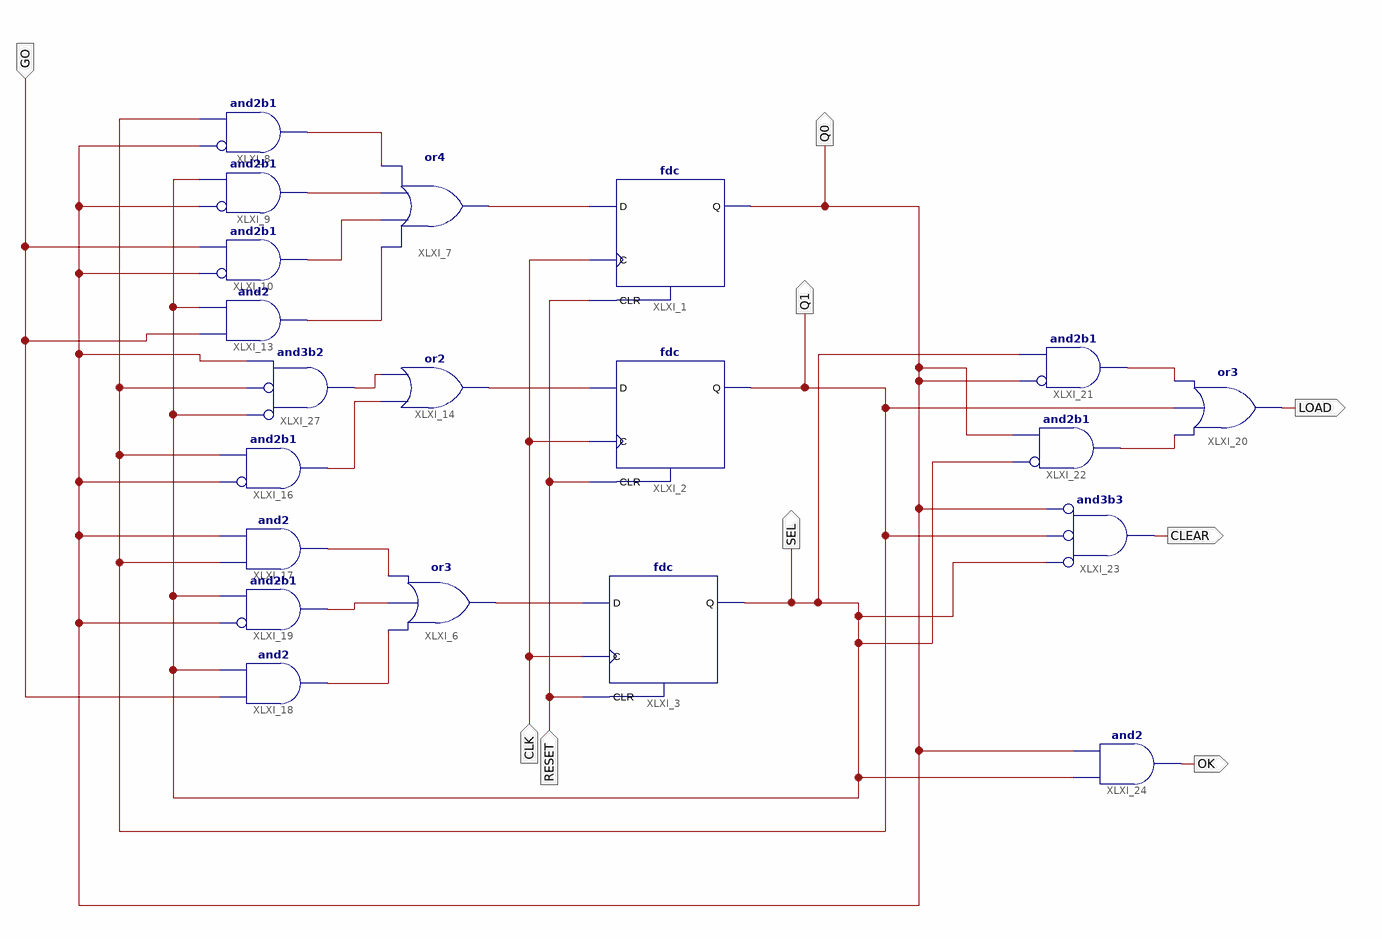
[diagram p0: schematic sheet 1]
// Xilinx ISE schematic Controlo.sch (spartan3e) as structural Verilog: 20 symbols, 9 ports
module Controlo (
  input  RESET,
  input  CLK,
  input  GO,
  output Q1,
  output Q0,
  output SEL,
  output OK,
  output CLEAR,
  output LOAD
);

  wire XLXN_10, XLXN_11, XLXN_12, XLXN_13, XLXN_14, XLXN_15, XLXN_16, XLXN_21, XLXN_22, XLXN_23, XLXN_24,
       XLXN_25, XLXN_36, XLXN_37;

  fdc XLXI_1 (.C(CLK), .CLR(RESET), .D(XLXN_10), .Q(Q0));
  fdc XLXI_2 (.C(CLK), .CLR(RESET), .D(XLXN_11), .Q(Q1));
  fdc XLXI_3 (.C(CLK), .CLR(RESET), .D(XLXN_12), .Q(SEL));
  or XLXI_6 (XLXN_12, XLXN_25, XLXN_24, XLXN_23);
  or XLXI_7 (XLXN_10, XLXN_16, XLXN_15, XLXN_14, XLXN_13);
  and XLXI_8 (XLXN_13, ~Q0, Q1);  // and2b1
  and XLXI_9 (XLXN_14, ~Q0, SEL);  // and2b1
  and XLXI_10 (XLXN_15, ~Q0, GO);  // and2b1
  and XLXI_13 (XLXN_16, GO, SEL);
  or XLXI_14 (XLXN_11, XLXN_22, XLXN_21);
  and XLXI_16 (XLXN_22, ~Q0, Q1);  // and2b1
  and XLXI_17 (XLXN_23, Q1, Q0);
  and XLXI_18 (XLXN_25, GO, SEL);
  and XLXI_19 (XLXN_24, ~Q0, SEL);  // and2b1
  or XLXI_20 (LOAD, XLXN_37, Q1, XLXN_36);
  and XLXI_21 (XLXN_36, ~Q0, SEL);  // and2b1
  and XLXI_22 (XLXN_37, ~SEL, Q0);  // and2b1
  and XLXI_23 (CLEAR, ~SEL, ~Q1, ~Q0);  // and3b3
  and XLXI_24 (OK, SEL, Q0);
  and XLXI_27 (XLXN_21, ~SEL, ~Q1, Q0);  // and3b2
endmodule
